# Altium schematic sheet Sheet1.SchDoc: ИЛ1385ТО1/1
size 410 x 297 mm; ApprovedBy: Стерхов В.Д.; CheckedBy: Стерхов В.Д.; Author: Сергеев Д.А.; CompanyName: ГК "СНАБЖЕНИЕ"; DrawnBy: Сергеев Д.А.; Engineer: Сергеев Д.А.; Organization: ГК "СНАБЖЕНИЕ"; DocumentNumber: ИЛ1385ТО1/1; Revision: 1; SheetNumber: 1; SheetTotal: 1
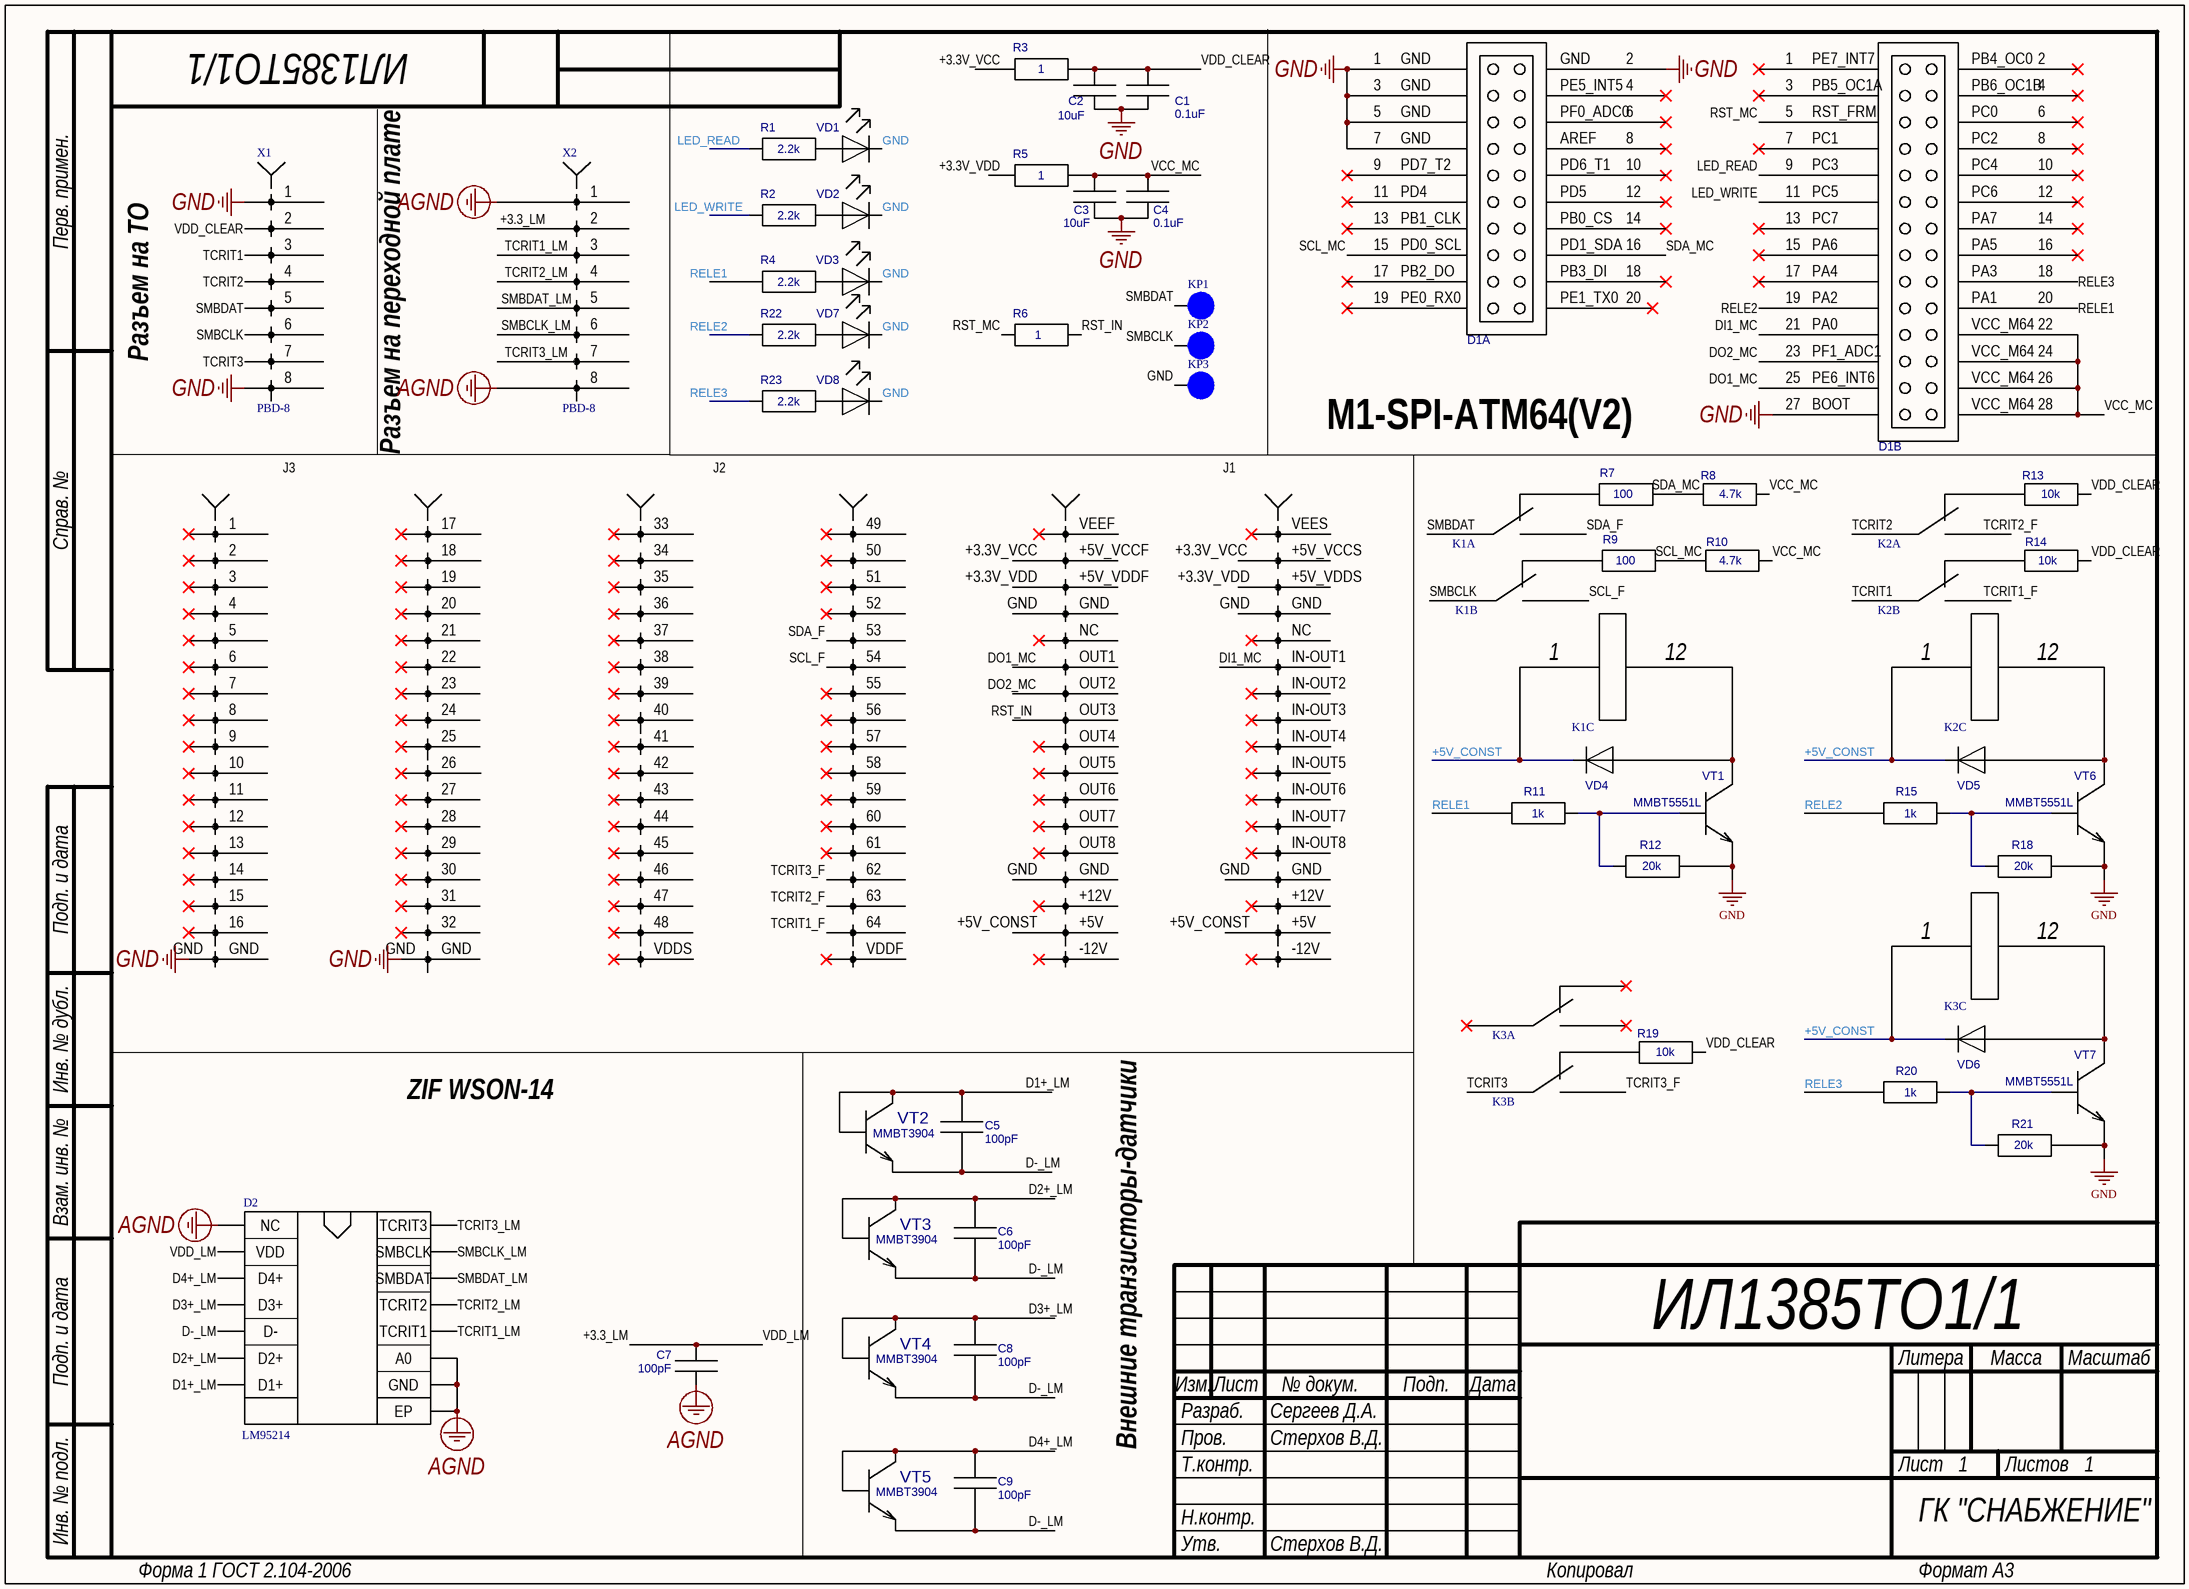
[diagram p0: Sheet1.SchDoc]

## Parts
C1  0.1uF  [0805]
C2  10uF  [0805]
C3  10uF  [0805]
C4  0.1uF  [0805]
C5  100pF  [0805]
C6  100pF  [0805]
C7  100pF  [0805]
C8  100pF  [0805]
C9  100pF  [0805]
D1  M1-SPI-ATM64(V2)  [M1-SPI-ATM64(V2)]  (value not drawn)  (parts A,B of 2)
D2  LM95214  [LM95214]
K1  V23079A1001B301 TE  [V23079A1001B301]  (value not drawn)  (parts A,B,C of 3)
K2  V23079A1001B301 TE  [V23079A1001B301]  (value not drawn)  (parts A,B,C of 3)
K3  V23079A1001B301 TE  [V23079A1001B301]  (value not drawn)  (parts A,B,C of 3)
KP1  Contact  [Contact]  (value not drawn)
KP2  Contact  [Contact]  (value not drawn)
KP3  Contact  [Contact]  (value not drawn)
R1  2.2k  [0805]
R2  2.2k  [0805]
R3  1  [0805]
R4  2.2k  [0805]
R5  1  [0805]
R6  1  [0805]
R7  100  [0805]
R8  4.7k  [0805]
R9  100  [0805]
R10  4.7k  [0805]
R11  1k  [0805]
R12  20k  [0805]
R13  10k  [0805]
R14  10k  [0805]
R15  1k  [0805]
R18  20k  [0805]
R19  10k  [0805]
R20  1k  [0805]
R21  20k  [0805]
R22  2.2k  [0805]
R23  2.2k  [0805]
VD1  LED(0805)  [0805(LED)]  (value not drawn)
VD2  LED(0805)  [0805(LED)]  (value not drawn)
VD3  LED(0805)  [0805(LED)]  (value not drawn)
VD4  LL4148 NXP  [SOD80C]  (value not drawn)
VD5  LL4148 NXP  [SOD80C]  (value not drawn)
VD6  LL4148 NXP  [SOD80C]  (value not drawn)
VD7  LED(0805)  [0805(LED)]  (value not drawn)
VD8  LED(0805)  [0805(LED)]  (value not drawn)
VT1  MMBT5551L  [SOT-23]
VT2  MMBT3904  [SOT-23]
VT3  MMBT3904  [SOT-23]
VT4  MMBT3904  [SOT-23]
VT5  MMBT3904  [SOT-23]
VT6  MMBT5551L  [SOT-23]
VT7  MMBT5551L  [SOT-23]
X1  PBD-8  [PBD-8]
X2  PBD-8  [PBD-8]
X3  FORMULA  [FORMULA]  (value not drawn)

## Nets
AGND: C7.2 D2.1 D2.8 D2.9 D2.15 X2.1 X2.8
GND: C1.2 C2.2 C3.2 C4.2 D1.1X2 D1.2X2 D1.3X2 D1.5X2 D1.7X2 D1.27X3 KP3.1 R12.2 R18.2 R21.2 VD1.2(K) VD2.2(K) VD3.2(K) VD7.2(K) VD8.2(K) VT1.2(E) VT6.2(E) VT7.2(E) X1.1 X1.8 X3.GND
+3.3_LM: C7.1 D2.2 X2.2  [also labelled VDD_LM]
+3.3V_VCC: R3.1 X3.+5V_VCCF(VCCF) X3.+5V_VCCS(VCCS)
+3.3V_VDD: R5.1 X3.+5V_VDDF(VDDF) X3.+5V_VDDS(VDDS)
+5V_CONST: K1.1 K2.1 K3.1 VD4.2(K) VD5.2(K) VD6.2(K) X3.+5V
D1+_LM: C5.2 D2.7 VT2.1(B) VT2.3(K)
D2+_LM: C6.2 D2.6 VT3.1(B) VT3.3(K)
D3+_LM: C8.2 D2.4 VT4.1(B) VT4.3(K)
D4+_LM: C9.2 D2.3 VT5.1(B) VT5.3(K)
D-_LM: C5.1 C6.1 C8.1 C9.1 D2.5 VT2.2(E) VT3.2(E) VT4.2(E) VT5.2(E)
DI1_MC: D1.21X3 X3.IN-OUT1
DO1_MC: D1.25X3 X3.OUT1
DO2_MC: D1.23X3 X3.OUT2
LED_READ: D1.9X3 R1.1
LED_WRITE: D1.11X3 R2.1
RELE1: D1.20X3 R4.1 R11.1
RELE2: D1.19X3 R15.1 R22.1
RELE3: D1.18X3 R20.1 R23.1
RST_IN: R6.2 X3.OUT3
RST_MC: D1.5X3 R6.1
SCL_F: K1.8 X3.54
SCL_MC: D1.15X2 R9.2 R10.1
SDA_F: K1.5 X3.53
SDA_MC: D1.16X2 R7.2 R8.1
SMBCLK: K1.9 KP2.1 X1.6
SMBCLK_LM: D2.13 X2.6
SMBDAT: K1.4 KP1.1 X1.5
SMBDAT_LM: D2.12 X2.5
TCRIT1: K2.9 X1.3
TCRIT1_F: K2.8 X3.64
TCRIT1_LM: D2.10 X2.3
TCRIT2: K2.4 X1.4
TCRIT2_F: K2.5 X3.63
TCRIT2_LM: D2.11 X2.4
TCRIT3: K3.9 X1.7
TCRIT3_F: K3.8 X3.62
TCRIT3_LM: D2.14 X2.7
VCC_MC: C3.1 C4.1 D1.22X3 D1.24X3 D1.26X3 D1.28X3 R5.2 R8.2 R10.2
VDD_CLEAR: C1.1 C2.1 R3.2 R13.2 R14.2 R19.2 X1.2
NetK1_3: K1.3 R7.1
NetK1_10: K1.10 R9.1
NetK1_12: K1.12 VD4.1(A) VT1.3(K)
NetK2_3: K2.3 R13.1
NetK2_10: K2.10 R14.1
NetK2_12: K2.12 VD5.1(A) VT6.3(K)
NetK3_10: K3.10 R19.1
NetK3_12: K3.12 VD6.1(A) VT7.3(K)
NetR1_2: R1.2 VD1.1(A)
NetR2_2: R2.2 VD2.1(A)
NetR4_2: R4.2 VD3.1(A)
NetR11_2: R11.2 R12.1 VT1.1(B)
NetR15_2: R15.2 R18.1 VT6.1(B)
NetR20_2: R20.2 R21.1 VT7.1(B)
NetR22_2: R22.2 VD7.1(A)
NetR23_2: R23.2 VD8.1(A)

Not connected (* = marked no-connect by the designer): D1 1X3* 2X3* 3X3* 4X2* 4X3* 6X2* 6X3* 7X3* 8X2* 8X3* 9X2* 10X2* 10X3* 11X2* 12X2* 12X3* 13X2* 13X3* 14X2* 14X3* 15X3* 16X3* 17X2* 17X3* 18X2* 19X2* 20X2*; K3 3* 4* 5*; X3 1* 2* 3* 4* 5* 6* 7* 8* 9* 10* 11* 12* 13* 14* 15* 16* 17* 18* 19* 20* 21* 22* 23* 24* 25* 26* 27* 28* 29* 30* 31* 32* 33* 34* 35* 36(4)* 37(5)* 38* 39* 40* 41* 42* 43* 44* 45* 46* 47* 48* 49* 50* 51* 52* 55* 56* 57* 58* 59* 60* 61* +12V* -12V* IN-OUT2* IN-OUT3* IN-OUT4* IN-OUT5* IN-OUT6* IN-OUT7* IN-OUT8* NC* OUT4* OUT5* OUT6* OUT7* OUT8* VDDF* VDDS* VEEF* VEES*

## Notes on the sheet
- Разъем на ТО
- Разъем на переходной плате
- M1-SPI-ATM64(V2)
- ZIF WSON-14
- Внешние транзисторы-датчики
- Перв. примен.
- Справ. №
- Подп. и дата
- Инв. № дубл.
- Взам. инв. №
- Разраб.
- Изм.
- Лист
- № докум.
- Подп.
- Дата
- Литера
- Масса
- Масштаб
- Пров.
- Т.контр.
- Листов
- Инв. № подл.
- Н.контр.
- Утв.
- Форма 1 ГОСТ 2.104-2006
- Копировал
- Формат А3
- (in symbol FORMULA) J3; J2; J1
- (in symbol LM95214) NC; TCRIT3; VDD; SMBCLK; D4+; SMBDAT; D3+; TCRIT2; D-; TCRIT1; D2+; A0; D1+; GND; EP
- (in symbol M1-SPI-ATM64(V2), part A) GND; 3; PE5_INT5; 4; 5; PF0_ADC0; 6; 7; AREF; 8; 9; PD7_T2; PD6_T1; 10; 11; PD4; PD5; 12; 13; PB1_CLK; PB0_CS; 14; 15; PD0_SCL; PD1_SDA; 16; 17; PB2_DO; PB3_DI; 18; 19; PE0_RX0; PE1_TX0; 20
- (in symbol M1-SPI-ATM64(V2), part B) PE7_INT7; PB4_OC0; 3; PB5_OC1A; PB6_OC1B; 4; 5; RST_FRM; PC0; 6; 7; PC1; PC2; 8; 9; PC3; PC4; 10; 11; PC5; PC6; 12; 13; PC7; PA7; 14; 15; PA6; PA5; 16; 17; PA4; PA3; 18; 19; PA2; PA1; 20; 21; PA0; VCC_M64; 22; 23; PF1_ADC1; 24; 25; PE6_INT6; 26; 27; BOOT; 28

## Library data of the parts
C1-C9 = C0805: ComponentHeigt: 1.3; Firme: AVX; Leadform: SMD; KIND: Конденсатор; ClassName: *; Component Link: *; ComponentWeigt: *; Packaging: 0805; NN: *; Value: *
D1 = M1-SPI-ATM64(V2): ComponentHeigt: 5.5; Name: Вилка; Specification: Вилка PLD2-2 *; Typ: PLD2-2; ClassName: *; Component Link: *; ComponentWeigt: *; Firme: *; Leadform: *; NN: *; KIND: *
R1-R15 R18-R23 = R0805 Yageo: ComponentHeigt: 0.6; Firme: Yageo; Leadform: SMD; Kind: Резистор; ClassName: *; ComponentWeigt: *; Component Link: *; Packaging: 0805; NN: *; Value: *
VD1-VD3 VD7 VD8 = LED(0805): ComponentHeigt: 0.75; Leadform: в отверстия; Firme: Kingbright; NN: 24003000; KIND: Светодиод L-1154GD Kingbright; Component Link: *; ClassName: *
VD4-VD6 = LL4148 NXP: ComponentHeigt: 1.6; Leadform: SMD; NN: 24009301; KIND: Диод LL4148 NXP; Component Link: http://www.nxp.com; Packaging: SOD-80C; ClassName: *; Firme: NXP
VT1-VT7 = MMBT5551L: ComponentHeigt: 1.1; Firme: ONS; Leadform: SMD; NN: 24007468; KIND: Транзистор MMBT5551L*G ONS; ClassName: *; ComponentWeigt: *; Packaging: SOT-23